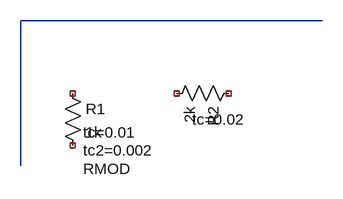
[diagram p0: schematic attribute_windows.asc]
attribute_windows.asc, the LTspice schematic file:
Version 4
SHEET 1 560 280
WIRE -32 -64 432 -64
WIRE -32 -64 -32 160
SYMBOL res 32 32 R0
WINDOW 39 32 76 Left 2
WINDOW 40 32 104 Left 2
WINDOW 38 32 132 Left 2
SYMATTR InstName R1
SYMATTR Value 1k
SYMATTR SpiceLine tc=0.01
SYMATTR SpiceLine2 tc2=0.002
SYMATTR SpiceModel RMOD
SYMBOL res 304 32 R90
WINDOW 39 72 32 VBottom 2
SYMATTR InstName R2
SYMATTR Value 2k
SYMATTR SpiceLine tc=0.02

The netlist it stands for:
* attribute_windows.asc
R1 NC_01 NC_02 RMOD 1k tc=0.01 tc2=0.002
R2 NC_03 NC_04 2k tc=0.02
.backanno
.end